# EasyEDA Pro project controler.epro, board PCB1_2
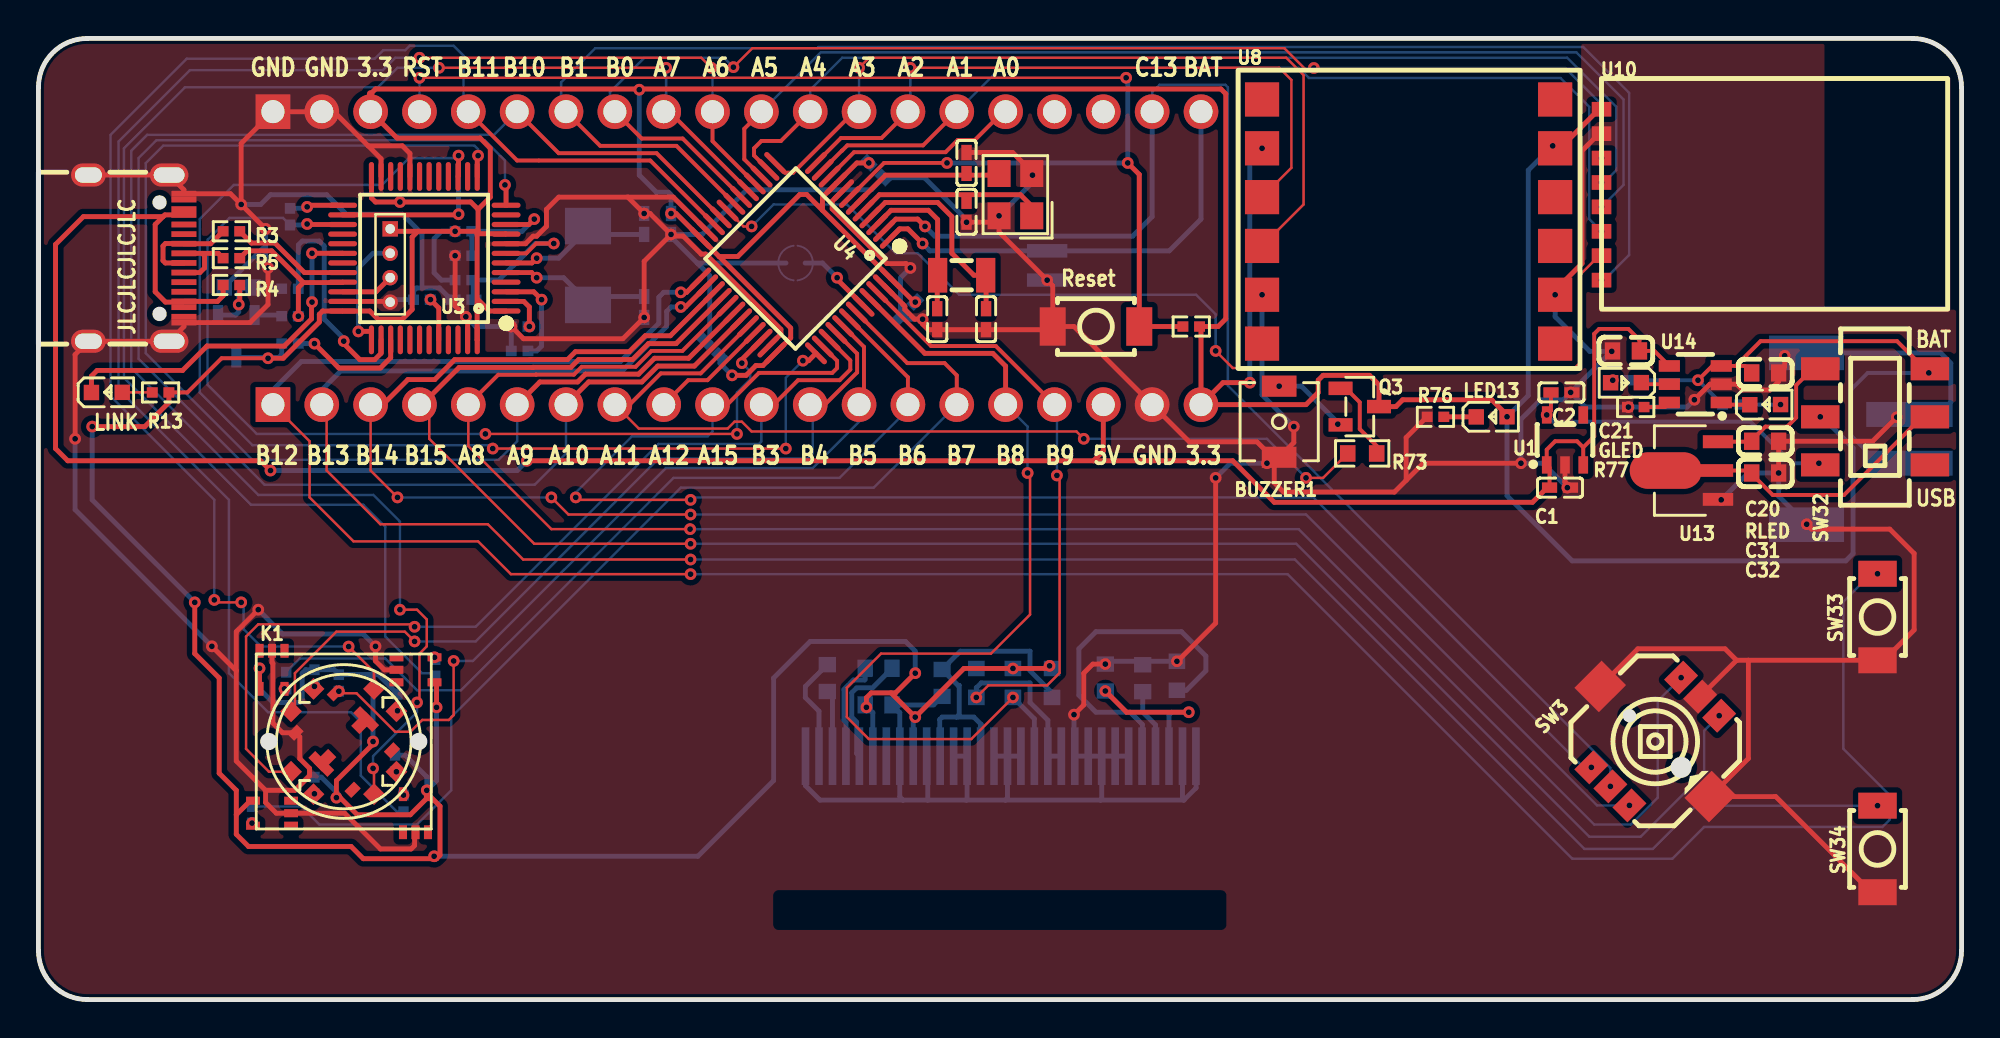
[diagram p1: board, top side]
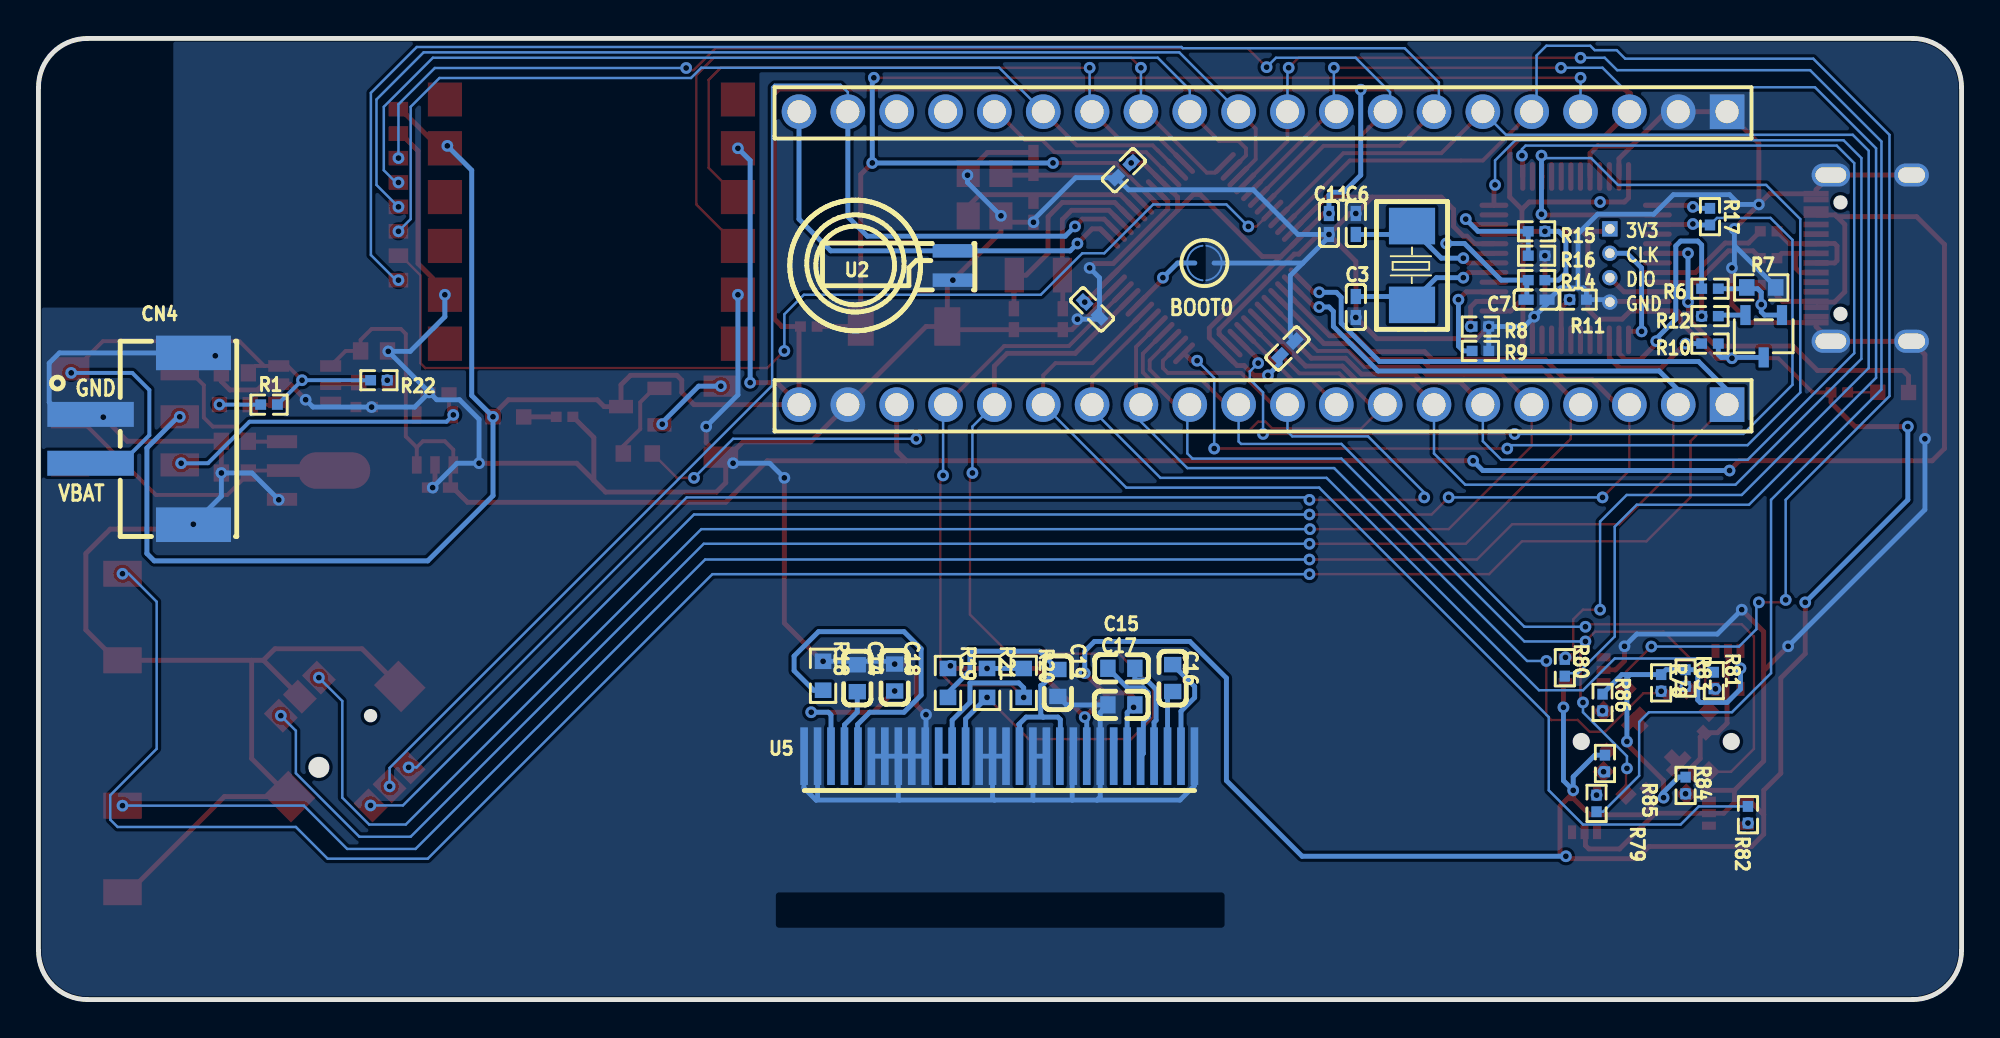
[diagram p2: board, bottom side, seen from below]

Outline 100 x 50 mm; copper layers: Top Layer, Bottom Layer. Coordinates in mm from the lower left corner of the outline.
Outline path: 0,47.46 0,2.54 arc(0.74,0.74) 2.54,0 97.46,0 arc(99.26,0.74) 100,2.54 100,47.46 arc(99.26,49.26) 97.46,50 2.54,50 arc(0.74,49.26) 0,47.46
Stack: Top Layer 0.035mm / Dielectric1 1.51mm FR4 er 4.5 / Bottom Layer 0.035mm

## Design rules (mm)
spacing safeClearance (default): track to track 0.152, other pairs 0.152 to 0.3
spacing Copper_copperRegion: track to track 0.152, other pairs 0.152 to 0.3
spacing Plane_innerPlane: track to track 0.152, other pairs 0.152 to 0.3
track width trackWidth (default): min 0.127, default 0.254, max 2.54
differential pair differentialPair (default): width min 0.127, default 0.254, max 2.54; gap min 0.152, default 0.152
net GND uses copperRegion

## Placement (name value [footprint] x y rotation side)
BUZZER1  4kHz  [BUZ-SMD_2P-L4.0-W4.0-L_GSC4317YA]  64.52 30.06 270 top
C1  1uF  [C0402_1]  79.12 26.63 180 top
C2  1uF  [C0402_1]  79.19 31.58 180 top
C3  20pF  [C0402]  31.5 36.03 270 bottom
C4  12pF  [C0402]  46.74 35.39 90 top
C5  12pF  [C0402]  49.28 35.39 270 top
C6  20pF  [C0402]  31.5 40.35 90 bottom
C7  100nF  [C0402]  22.1 36.41 0 bottom
C8  20pF  [C0402]  48.26 40.98 90 top
C9  20pF  [C0402]  48.26 43.52 270 top
C10  100nF  [C0402]  43.56 43.14 135 bottom
C11  100nF  [C0402]  32.89 40.35 90 bottom
C12  100nF  [C0402]  35.05 33.87 315 bottom
C13  100nF  [C0402]  45.21 35.9 45 bottom
C14  4.7uf  [C0603]  57.42 16.72 270 bottom
C15  1uf  [C0603]  43.69 17.23 0 bottom
C16  1uf  [C0603]  41.02 16.73 90 bottom
C17  10uf  [C0603]  43.69 15.33 180 bottom
C18  2.2uf  [C0603]  55.48 16.75 270 bottom
C19  100nF  [C0603]  46.99 16.47 270 bottom
C20  10uF  [C0603_1]  89.79 32.6 180 top
C21  10uF  [C0603_1]  82.55 33.74 0 top
C31  10u  [C0603_1]  89.79 29.05 180 top
C32  10u  [C0603_1]  89.79 27.39 180 top
CN4  2.54-2A-LT  [CONN-SMD_2P-P2.54_XH2.54-2AB]  94.62 29.17 270 bottom
GLED  ORH-G36G  [LED0603-RD_1]  82.55 32.09 180 top
J1  -  [HDR-TH_20P-P2.54-V-M-1]  36.32 46.19 0 bottom
J2  -  [HDR-TH_20P-P2.54-V-M-1]  36.32 30.95 0 bottom
K1  -  [EVQWJN005]  15.88 13.42 0 top
LED2  NCD0603Y1  [LED0603-RD]  3.56 31.58 0 top
LED13  -  [LED0603-RD_1]  75.56 30.31 0 top
P1  -  [1.27-4P烧录孔]  18.29 38.19 270 top
PAN1  -  [短接焊盘-2mm]  39.37 38.32 0 bottom
Q1  S8050 J3Y  [SOT-23-3_L3.0-W1.7-P0.95-LS2.9-BR]  10.29 34.51 90 bottom
Q3  S8550  [SOT-23-3_L2.9-W1.3-P1.90-LS2.4-BR]  68.71 30.85 180 top
R1  1K  [R0402_1]  88.01 30.95 180 bottom
R2  10kΩ  [R0402]  59.94 35.01 0 top
R3  10Ω  [R0402]  10.03 39.97 0 top
R4  10kΩ  [R0402]  10.03 37.17 180 top
R5  10Ω  [R0402]  10.03 38.57 0 top
R6  100Ω  [R0402]  13.08 36.98 0 bottom
R7  36kΩ  [R0603]  10.41 37.05 0 bottom
R8  10kΩ  [R0402]  25.02 35.01 180 bottom
R9  10kΩ  [R0402]  25.02 33.74 180 bottom
R10  4.7kΩ  [R0402]  13.08 34.12 180 bottom
R11  10kΩ  [R0402]  19.94 36.41 0 bottom
R12  1.5kΩ  [R0402]  13.08 35.55 180 bottom
R13  1kΩ  [R0402]  6.35 31.58 180 top
R14  100kΩ  [R0402]  22.1 37.43 180 bottom
R15  4.7kΩ  [R0402]  22.1 39.97 180 bottom
R16  4.7kΩ  [R0402]  22.1 38.7 0 bottom
R17  100Ω  [R0402]  13.08 40.73 270 bottom
R18  1M  [R0603]  59.2 16.84 270 bottom
R19  5.1k  [R0603]  52.71 16.47 270 bottom
R20  5.1k  [R0603]  48.77 16.47 270 bottom
R21  5.1k  [R0603]  50.67 16.47 270 bottom
R22  1K  [R0402_1]  82.3 32.22 0 bottom
R73  1kΩ  [R0603]  68.83 28.41 180 top
R76  1kΩ  [R0402_1]  72.64 30.31 0 top
R77  1.5K  [R0402_1]  83.06 30.82 0 top
R78  4.7K  [R0402]  15.62 16.47 90 bottom
R79  10kΩ  [R0402]  18.98 10.2 270 bottom
R80  10kΩ  [R0402]  20.63 17.26 270 bottom
R81  10kΩ  [R0402]  12.88 16.59 90 bottom
R82  10kΩ  [R0402]  11.11 9.61 90 bottom
R83  1kΩ  [R0402]  14.35 16.73 270 bottom
R84  1kΩ  [R0402]  14.35 11.14 270 bottom
R85  1kΩ  [R0402]  18.54 12.28 270 bottom
R86  1kΩ  [R0402]  18.67 15.46 270 bottom
RLED  ORH-G36G  [LED0603-RD_1]  89.79 30.95 0 top
SW1  -  [SW-SMD_L3.9-W2.9-P4.15-LS5.0]  54.99 35.01 0 top
SW3  K1-5202UA-01  [SW-SMD_K1-5202UA-01]  84.07 13.42 45 top
SW32  MST22D18G2  [SW-SMD_MST22D18G2]  95.5 30.31 90 top
SW33  -  [SW-SMD_L3.9-W2.9-P4.15-LS5.0]  95.63 19.9 90 top
SW34  -  [SW-SMD_L3.9-W2.9-P4.15-LS5.0]  95.63 7.84 90 top
U1  XC6210B332MR  [SOT-25_L3.0-W1.6-P0.95-LS2.8-BL_1]  79.38 29.11 0 top
U2  -  [CAP-SMD_FL11E]  52.45 38.19 180 bottom
U3  STM32F103CBT6  [LQFP-48_L7.0-W7.0-P0.50-LS9.0-BL]  20.07 38.57 90 top
U4  -  [LQFP-48_L7.0-W7.0-P0.50-LS9.0-BL]  39.37 38.57 135 top
U5  SSD1306  [1.3OLED-2]  50.42 13.42 0 bottom
U8  -  [JY901S]  63.63 46.83 0 top
U10  -  [nrf24f01贴片模块]  81.28 46.32 0 top
U13  ME6209A33PG  [SOT-89-3_L4.5-W2.5-P1.50-LS4.2-BR]  85.98 27.52 0 top
U14  TP4059  [SOT-23-6_L2.9-W1.6-P0.95-LS2.8-BR]  86.16 32.01 0 top
USB1  -  [USB-C_SMD-TYPE-C-31-M-12]  5.08 38.57 270 top
X1  32.768kHz  [FC-135R_L3.2-W1.5]  48.01 37.68 0 top
X2  8MHz  [CRYSTAL-SMD_L5.0-W3.2]  28.57 38.19 270 bottom
X3  8MHz  [CRYSTAL-SMD_4P-L3.2-W2.5-BL]  50.8 41.87 90 top

## Footprints (pads in the part's own frame, mm; a bottom-side part is the same pattern mirrored in y, then rotated)
1.3OLED-2
  rect 0.4x3 smd: 1(-10.531,0.762) 2(-9.831,0.763) 3(-9.131,0.762) 4(-8.431,0.762) 5(-7.731,0.762) 6(-7.031,0.762) 7(-6.331,0.762) 8(-5.631,0.762) 9(-4.931,0.762) 10(-4.231,0.762) 11(-3.531,0.762) 12(-2.831,0.762) 13(-2.131,0.762) 14(-1.431,0.762) 15(-0.731,0.762) 16(-0.031,0.762) 17(0.669,0.762) 18(1.369,0.762) 19(2.069,0.763) 20(2.769,0.762) 21(3.469,0.761) 22(4.169,0.762) 23(4.869,0.762) 24(5.569,0.762) 25(6.269,0.763) 26(6.969,0.762) 27(7.669,0.763) 28(8.369,0.762) 29(9.069,0.762) 30(9.769,0.762)
1.27-4P烧录孔
  rect 0.8x0.8 hole 0.5: 1(-1.905,0)
  round 0.8 hole 0.5: 2(-0.635,0) 3(0.635,0) 4(1.905,0)
BUZ-SMD_2P-L4.0-W4.0-L_GSC4317YA
  rect 1.1x1.8 smd: 1(-1.85,0) 2(1.85,0)
C0402
  rect 0.79x0.54 smd: 1(-0.545,0) 2(0.545,0)
C0402_1
  rect 0.79x0.54 smd: 1(-0.545,0) 2(0.545,0)
C0603
  rect 0.8x0.9 smd: 1(-0.7,0) 2(0.7,0)
C0603_1
  rect 0.8x0.9 smd: 1(-0.7,0) 2(0.7,0)
CAP-SMD_FL11E
  rect 2.1x0.7 smd: 1(0,0.762) 2(0,-0.762)
CONN-SMD_2P-P2.54_XH2.54-2AB
  rect 1.3x4.5 smd: 1(-1.27,-2.675) 2(1.27,-2.675)
  rect 1.8x3.9 smd: 3(-4.47,2.675) 4(4.47,2.675)
CRYSTAL-SMD_4P-L3.2-W2.5-BL
  rect 1.4x1.2 smd: 1(-1.1,-0.85) 2(1.1,-0.85) 3(1.1,0.85) 4(-1.1,0.85)
CRYSTAL-SMD_L5.0-W3.2
  rect 1.9x2.401 smd: 1(-2.05,0) 2(2.05,0)
EVQWJN005
  rect 0.42x0.72 smd: A1(3.73,-4.72) A2(4.38,-2.74) A3(3.08,-2.74) A4(4.38,-4.72) A5(3.08,-4.72) C1(-3.73,4.72) C2(-4.38,2.74) C3(-3.08,2.74) C4(-4.38,4.72) C5(-3.08,4.72)
  rect 0.72x0.42 smd: B1(2.74,3.73) B2(4.72,3.08) B3(4.72,4.38) B4(2.74,3.08) B5(2.74,4.38) D1(-2.74,-3.73) D2(-4.72,-3.08) D3(-4.72,-4.38) D4(-2.74,-3.08) D5(-2.74,-4.38)
  rect 0.5x0.7 smd rot 135: K1(-0.46,2.51) K2(-2.51,0.46) K3(0.46,-2.51) K4(2.51,-0.46)
  rect 0.8x0.8 smd rot 135: L1(-1.573,2.74) L2(-2.74,1.573) L5(2.74,-1.573) L6(1.573,-2.74)
  rect 0.8x0.8 smd rot 45: L3(-1.573,-2.74) L4(-2.74,-1.573) L7(2.74,1.573) L8(1.573,2.74)
  rect 0.6x1.05 smd rot 135: T1(0.972,0.972) T2(-0.972,-0.972)
  rect 1.4x0.5 smd rot 135: T1(1.167,1.167) T2(-1.167,-1.167)
FC-135R_L3.2-W1.5
  rect 1.001x1.801 smd: 1(-1.25,0) 2(1.25,0)
HDR-TH_20P-P2.54-V-M-1
  rect 1.801x1.801 hole 1.199: 1(-24.13,0)
  round 1.801 hole 1.199: 2(-21.59,0) 3(-19.05,0) 4(-16.51,0) 5(-13.97,0) 6(-11.43,0) 7(-8.89,0) 8(-6.35,0) 9(-3.81,0) 10(-1.27,0) 11(1.27,0) 12(3.81,0) 13(6.35,0) 14(8.89,0) 15(11.43,0) 16(13.97,0) 17(16.51,0) 18(19.05,0) 19(21.59,0) 20(24.13,0)
JY901S
  rect 1.778x1.778 smd: 1(0,0) 2(0,-2.54) 3(0,-5.08) 4(0,-7.62) 5(0,-10.16) 6(0,-12.7) 7(15.24,-12.7) 8(15.24,-10.16) 9(15.24,-7.62) 10(15.24,-5.08) 11(15.24,-2.54) 12(15.24,0)
LED0603-RD
  rect 0.8x0.8 smd: 1(-0.799,-0.004) 2(0.799,0.004)
LED0603-RD_1
  rect 0.8x0.8 smd: 1(-0.799,-0.004) 2(0.799,0.004)
LQFP-48_L7.0-W7.0-P0.50-LS9.0-BL
  oval 0.269x1.501 smd: 1(-2.751,-4.25) 2(-2.251,-4.25) 3(-1.75,-4.25) 4(-1.25,-4.25) 5(-0.75,-4.25) 6(-0.249,-4.25) 7(0.249,-4.25) 8(0.75,-4.25) 9(1.25,-4.25) 10(1.75,-4.25) 11(2.251,-4.25) 12(2.751,-4.25) 25(2.751,4.25) 26(2.251,4.25) 27(1.75,4.25) 28(1.25,4.25) 29(0.75,4.25) 30(0.249,4.25) 31(-0.249,4.25) 32(-0.75,4.25) 33(-1.25,4.25) 34(-1.75,4.25) 35(-2.251,4.25) 36(-2.751,4.25)
  oval 1.501x0.269 smd: 13(4.25,-2.751) 14(4.25,-2.251) 15(4.25,-1.75) 16(4.25,-1.25) 17(4.25,-0.75) 18(4.25,-0.249) 19(4.25,0.249) 20(4.25,0.75) 21(4.25,1.25) 22(4.25,1.75) 23(4.25,2.251) 24(4.25,2.751) 37(-4.25,2.751) 38(-4.25,2.251) 39(-4.25,1.75) 40(-4.25,1.25) 41(-4.25,0.75) 42(-4.25,0.249) 43(-4.25,-0.249) 44(-4.25,-0.75) 45(-4.25,-1.25) 46(-4.25,-1.75) 47(-4.25,-2.251) 48(-4.25,-2.751)
nrf24f01贴片模块
  rect 1.016x0.762 smd: 1(0,0) 2(0,-1.27) 3(0,-2.54) 4(0,-3.81) 5(0,-5.08) 6(0,-6.35) 7(0,-7.62) 8(0,-8.89)
R0402
  rect 0.566x0.54 smd: 1(-0.433,0) 2(0.433,0)
R0402_1
  rect 0.566x0.54 smd: 1(-0.433,0) 2(0.433,0)
R0603
  rect 0.806x0.864 smd: 1(-0.753,0) 2(0.753,0)
SOT-23-3_L2.9-W1.3-P1.90-LS2.4-BR
  rect 1.25x0.7 smd: 1(1,-0.95) 2(1,0.95) 3(-1,0)
SOT-23-3_L3.0-W1.7-P0.95-LS2.9-BR
  rect 1.038x0.532 smd: 1(1.101,-0.95) 2(1.101,0.95) 3(-1.101,0)
SOT-23-6_L2.9-W1.6-P0.95-LS2.8-BR
  rect 1.1x0.6 smd: 1(1.35,-0.95) 2(1.35,0) 3(1.35,0.95) 4(-1.35,0.95) 5(-1.35,0) 6(-1.35,-0.95)
SOT-25_L3.0-W1.6-P0.95-LS2.8-BL_1
  rect 0.5x0.899 smd: 1(-0.95,-1.3) 2(0,-1.3) 3(0.95,-1.3) 4(0.95,1.3) 5(-0.95,1.3)
SOT-89-3_L4.5-W2.5-P1.50-LS4.2-BR
  rect 1.575x0.672 smd: 1(1.356,-1.5) 3(1.356,1.5)
  custom 5.377x1.9 smd: 2(-1.356,0)
SW-SMD_K1-5202UA-01
  rect 1.4x1.1 smd: 1(-3.3,1.4) 2(-3.3,0) 3(-3.3,-1.4) 4(3.3,1.4) 5(3.3,0) 6(3.3,-1.4)
  rect 2x1.8 smd: 7(0,4.05) 8(0,-4.05)
SW-SMD_L3.9-W2.9-P4.15-LS5.0
  rect 1.351x1.999 smd: 1(-2.251,0) 2(2.251,0)
SW-SMD_MST22D18G2
  rect 1.2x2 smd: 1(-2.5,2.85) 2(0,2.85) 3(2.5,2.85) 4(-2.5,-2.85) 5(0,-2.85) 6(2.5,-2.85)
USB-C_SMD-TYPE-C-31-M-12
  oval 1.2x2 hole 0.8x1.6: 0(-4.325,1.716) 0(4.325,1.716)
  oval 1.2x1.8 hole 0.8x1.4: 0(-4.325,-2.484) 0(4.325,-2.484)
  rect 0.3x1.3 smd: A1(-3.35,2.484) A4(-2.55,2.484) A5(-1.25,2.484) A6(-0.25,2.484) A7(0.25,2.484) A8(1.25,2.484) A9(2.55,2.484) A12(3.35,2.484) B1(3.05,2.484) B4(2.25,2.484) B5(1.75,2.484) B6(0.75,2.484) B7(-0.75,2.484) B8(-1.75,2.484) B9(-2.25,2.484) B12(-3.05,2.484)
短接焊盘-2mm
  custom 0.8x1.8 smd: 1(-0.5,0) 2(0.5,0)

## Nets
As in the schematic, except:
GND: BUZZER1.2 C1.1 C2.1 C3.2 C4.1 C5.2 C6.2 C7.1 C8.1 C9.1 C10.1 C11.1 C12.1 C13.1 C14.1 C17.1 C18.1 C19.2 C20.1 C21.1 C31.1 C32.1 CN4.1 CN4.3 CN4.4 J1.1 J1.2 J2.19 K1.A1 K1.B1 K1.C1 K1.D1 K1.K2 P1.4 PAN1.1 R7.1 R8.2 R9.2 R11.1 R16.1 R18.1 R76.1 R77.1 SW1.1 SW3.5 SW3.7 SW3.8 SW33.1 SW34.1 U1.2 U2.2 U3.8 U3.20 U3.23 U3.35 U3.47 U4.8 U4.23 U4.35 U4.47 U5.1 U5.8 U5.10 U5.12 U5.13 U5.15 U5.16 U5.17 U5.21 U5.22 U5.23 U5.24 U5.25 U5.29 U5.30 U8.5 U8.8 U10.2 U13.1 U14.2 USB1.0 USB1.A1 USB1.A12 USB1.B1 USB1.B12 X3.2 X3.4

Pads without a net: J1 17 18; K1 A4 A5 B4 B5 C4 C5 D4 D5 K3 K4 T1 T2; SW32 4; U1 4; U3 4 11 14 16 17 18 19 21 22 28 29 31 40 41 42 43 45 46; U5 7; U8 1 6 7 9 10 12; USB1 A5 A8 B5 B8

## Via types
v1: diameter 0.61, hole 0.305, Top Layer to Bottom Layer, 166 vias

## Routing (per net, layer and track width the routed paths; a pad name or vN(x,y) marks a point on that pad's centre or on a via; arc(x,y) is an arc through that point)
3V3: length 380.6
  Top Layer w0.203: v1(11.94,33.36) 9.53,33.36 7.75,31.58 R13.1
  Top Layer w0.254: v1(76.36,30.32) 76.36,30.4 75.56,31.2 70.94,31.2 70.59,30.85 Q3.3 69.71,31.98 69.22,32.47 66.8,32.47 66.55,32.22 66.55,31.58 65.91,30.95 J2.20 ; K1.A2 20.88,10.06 20.88,7.51 20.7,7.33 ; K1.A2 20.25,10.53 19.33,9.61 16.58,9.61 15.69,10.5 v1(15.49,10.5) 15.49,11.39 17.4,13.3 v1(17.4,13.42) ; K1.A2 20.19,10.75 v1(20.19,10.88) ; U3.24 17.31,41.7 17.53,41.49 v1(18.8,41.49) 22.48,41.49 22.86,41.11 ; K1.D2 11.02,10.34 10.29,9.61 ; 20.7,7.33 16.89,7.33 16.26,7.96 10.92,7.96 10.29,8.6 10.29,9.61 ; 20.7,7.33 v1(20.57,7.45) ; U3.48 22.81,34.33 22.81,39.84 24.3,39.84 U3.9 ; v1(45.59,16.98) 44.57,15.95 44.33,15.95 ; 19.73,39.97 18.42,39.97 P1.1 ; 19.73,39.97 19.43,39.67 19.43,35.9 18.92,35.39 17.65,35.39 17.23,35.82 14.78,35.82 14.61,35.65 14.61,35.24 12.73,33.36 v1(11.94,33.36) ; 19.73,39.97 v1(21.67,39.97) 22.86,39.97 22.86,41.11 ; 44.33,15.95 43.31,15.95 43.05,15.7 v1(43.05,15.2) ; 44.33,15.95 v1(45.59,14.69) 48.12,17.22 v1(50.67,17.22) 52.58,17.22 v1(52.58,17.36) ; 10.29,9.61 10.29,10.88 9.4,11.77 9.4,16.73 8.13,18 v1(8.13,20.66) ; 35.39,38.66 39.12,34.93 39.12,34.43 U4.36 37.67,32.98 37.31,32.98 36.8,32.47 v1(36.07,32.47) ; 35.39,38.66 36.37,38.66 39.59,41.88 39.95,41.88 40.77,41.06 ; 35.39,38.66 U4.24 33.16,40.89 v1(32.89,40.89) ; K1.C2 v1(11.5,17.23) ; v1(62.99,32.09) 61.59,32.09 J2.20 ; J2.20 60.45,34.94 R2.2 61.34,35.01 61.74,35.41 61.74,47.12 61.49,47.37 17.53,47.37 17.27,47.12 ; 22.86,41.11 23.5,41.75 23.5,44.28 22.96,44.82 18.64,44.82 J1.3 ; U10.1 81.15,46.32 79.25,44.41 v1(78.74,44.41) U8.11 ; 40.77,41.06 40.77,41.75 41.48,42.46 U4.9 42.56,43.52 v1(43.18,43.52) ; 40.77,41.06 U4.48 45.55,36.28 v1(45.59,36.28) ; v1(20.7,15.2) 20.7,16.4 K1.B2 ; 22.86,36.41 23.45,35.82 24.32,35.82 ; v1(2.79,29.81) 5.53,29.81 6.78,31.06 R13.1
  Top Layer w0.381: J1.3 17.27,47.12
  Bottom Layer w0.254: U5.9 45.49,14.59 v1(45.59,14.69) ; v1(31.24,47.33) 31.24,42.89 32.13,42 32.77,42 32.89,41.87 v1(32.89,40.89) ; v1(21.67,39.97) 20.95,39.97 20.57,39.59 20.57,37.81 20.95,37.43 R14.2 ; v1(92.65,30.31) 92.74,30.31 94.36,28.69 94.36,23.2 93.98,22.82 79.76,22.82 76.36,26.21 v1(76.36,30.32) 77.47,31.42 77.47,43.14 v1(78.74,44.41) ; v1(43.05,15.2) 42.99,15.27 C17.2 43.39,14.93 U5.6 ; v1(20.57,7.45) 34.29,7.45 38.23,11.39 38.23,16.73 40.13,18.63 45.09,18.63 45.59,18.12 v1(45.59,16.98) ; v1(8.13,20.66) 2.79,26 v1(2.79,29.81) ; 17.23,16.91 17.4,16.74 v1(17.4,13.42) ; 17.23,16.91 R78.2 15.37,17.16 R83.1 ; 17.23,16.91 17.67,16.91 18.67,15.9 18.67,15.89 ; 48.77,17.22 v1(50.67,17.22) ; v1(15.49,10.5) 15.57,10.58 15.57,10.71 14.71,11.57 R84.1 ; v1(36.07,32.47) 35.44,33.1 C12.2 ; v1(20.7,15.2) 20.7,11.39 v1(20.19,10.88) 20.19,11.59 19.07,12.71 R85.1 ; v1(52.58,17.36) 52.71,17.23 52.71,17.22 ; 14.35,17.16 13.9,17.16 13.72,16.98 13.72,15.58 13.59,15.46 12.19,15.46 11.5,16.15 v1(11.5,17.23) ; v1(62.99,32.09) 62.99,43.65 v1(63.63,44.28) ; R10.2 12.65,33.56 12.49,33.4 Q1.3
GND: length 471.4
  Top Layer w0.254: 88.3,17.65 88.92,17.65 ; 88.3,17.65 SW3.5 ; 88.3,17.65 87.7,18.25 83.17,18.25 SW3.7 ; 88.92,17.65 SW33.1 95.96,17.65 97.54,19.23 97.54,23.2 96.27,24.47 92.2,24.47 v1(91.95,24.73) ; 88.92,17.65 88.92,12.54 SW3.8 90.33,10.56 95.31,5.59 SW34.1 ; SW1.1 53.85,35.01 J2.19 59.85,29.02 63.36,29.02 64.17,28.21 BUZZER1.2 ; SW1.1 52.58,34.85 C5.2 C4.1 46.26,34.85 45.97,35.14 v1(45.97,35.39) 45.56,35.39 45.05,35.9 45.05,36.06 44.96,36.16 44.96,36.16 U4.47 ; SW1.1 52.74,37.14 v1(52.45,37.43) 49.95,39.93 v1(49.95,40.77) 49.62,40.44 v1(48.26,40.44) ; 30.64,41.75 33.01,41.75 U4.23 ; 30.64,41.75 v1(31.5,40.89) 31.8,40.89 v1(32.89,39.8) ; 30.64,41.75 27.05,41.75 26.42,41.11 26.42,40.22 25.91,39.71 25.72,39.71 25.33,39.32 U3.8 ; U4.35 38.61,34.63 38.61,34.87 34.69,38.78 34.46,38.78 33.53,39.71 32.98,39.71 v1(32.89,39.8) ; v1(32.89,39.8) 31.5,38.41 v1(31.5,35.48) 30.39,34.38 25.22,34.38 v1(24.59,35.01) ; U3.23 17.82,43.74 17.14,44.41 ; 11.81,10.88 11.81,10.25 12.37,9.69 K1.D1 15.92,9.69 17.78,7.84 19.38,7.84 19.56,8.02 19.56,8.66 K1.A1 ; 11.81,10.88 13.33,10.88 14.1,11.65 14.1,12.03 13.59,12.53 13.59,13.66 K1.K2 12.69,13.88 12.19,14.38 12.19,17.48 12.14,17.53 K1.C1 ; 11.81,10.88 10.29,12.41 10.29,17.11 ; v1(17.53,18.38) 17.53,17.61 17.99,17.15 K1.B1 ; 17.14,44.41 18.92,44.41 19.32,44.02 U3.20 ; 17.14,44.41 15.37,46.19 J1.2 J1.1 10.54,44.54 v1(10.54,41.36) ; C9.1 50.65,44.07 51.65,43.07 X3.2 51.69,42.93 v1(51.69,42.89) ; v1(81.81,33.72) 81.83,33.72 C21.1 ; v1(59.2,17.6) 59.23,17.6 61.21,19.58 v1(61.21,27.14) ; v1(77.09,27.9) 72.01,27.9 71.12,27.01 ; 64.26,27.96 BUZZER1.2 ; 64.26,27.96 64.26,26.89 64.74,26.4 70.51,26.4 71.12,27.01 ; 64.26,27.96 64.21,27.9 v1(63.88,27.9) ; BUZZER1.2 65.28,28.97 v1(65.28,29.81) ; v1(87.5,26) 87.36,26 U13.1 ; v1(45.34,38.06) 45.11,38.29 44.12,38.29 41.28,41.13 41.28,41.53 U4.8 ; v1(90.81,33.49) 90.81,32.92 C20.1 90.49,32.16 90.04,31.71 88.61,31.71 88.31,32.01 U14.2 86.91,32.01 v1(86.11,31.2) ; v1(96.63,30.3) 95.38,29.05 C31.1 v1(90.49,27.39) ; v1(9.02,18.38) 10.29,17.11 ; 10.29,17.11 10.29,19.14 v1(11.43,20.28) ; v1(53.85,14.82) 54.36,15.33 54.36,16.98 54.83,17.45 v1(55.48,17.45) ; 71.12,27.01 71.12,29.24 72.2,30.31 R76.1 ; v1(1.91,29.17) 1.91,33.55 USB1.0 USB1.0 7.56,35.01 USB1.A12 11,35.22 11.94,36.16 v1(11.94,38.06) ; USB1.0 USB1.0 7.56,42.13 USB1.A1 9.98,41.92 v1(10.54,41.36) ; v1(79.5,26.63) C1.1 79.38,26.92 U1.2 ; U3.47 22.32,35.43 v1(22.22,35.52) 21.67,36.08 v1(21.67,38.7) ; U3.35 18.25,36.32 P1.4 ; v1(10.54,41.36) v1(11.81,40.09) ; 79.68,31.58 C2.1 ; v1(78.87,36.67) 78.75,36.78 80.26,38.29 80.26,44.16 81.15,45.05 U10.2
  Bottom Layer w0.254: U5.12 U5.13 48.29,10.42 48.25,10.38 ; U5.16 50.39,10.48 50.28,10.38 ; U5.16 U5.17 ; U5.16 U5.15 ; 44.96,10.38 44.79,10.55 U5.8 44.79,14.93 C17.1 46.55,15.33 C19.2 ; 44.96,10.38 40.64,10.38 39.89,11.13 U5.1 ; 44.96,10.38 46.24,10.38 ; 50.28,10.38 55.23,10.38 ; 50.28,10.38 48.25,10.38 ; v1(79.67,31.59) 79.29,31.2 78.1,31.2 77.09,30.19 v1(77.09,27.9) 78.23,27.9 v1(79.5,26.63) ; v1(79.67,31.59) v1(81.81,33.72) 80.67,33.72 78.87,35.52 v1(78.87,36.67) ; v1(79.67,31.59) 80.44,30.82 v1(82.68,30.82) 85.72,30.82 v1(86.11,31.2) ; 19.94,37.02 19.94,39.84 18.92,40.86 16,40.86 14.99,41.87 12.06,41.87 11.56,41.36 v1(10.54,41.36) ; 19.94,37.02 20.85,37.02 21.46,36.41 C7.1 21.55,36.19 v1(22.22,35.52) 22.73,35.01 v1(24.59,35.01) R9.2 ; 19.94,37.02 19.66,37.02 19.51,36.87 R11.1 18.42,36.41 P1.4 ; 11.81,39.22 11.81,38.19 v1(11.94,38.06) ; 11.81,39.22 9.66,37.08 R7.1 ; 11.81,39.22 v1(11.81,40.09) ; v1(59.2,17.6) 55.62,17.6 v1(55.48,17.45) ; 55.23,10.38 59.56,10.38 ; 55.23,10.38 55.29,10.43 U5.23 ; 59.56,10.38 59.49,10.45 U5.29 ; 59.56,10.38 60.2,11.01 60.2,12.65 U5.30 ; U5.10 46.24,12.61 46.24,10.38 ; v1(53.85,14.82) 53.85,12.7 U5.21 U5.22 U5.23 ; U5.23 U5.24 ; v1(51.69,42.89) 51.69,42.51 v1(49.95,40.77) ; v1(63.63,36.67) 63.63,31.46 v1(65.28,29.81) ; v1(96.63,30.3) 96.77,30.44 CN4.1 98.81,30.44 99.44,31.08 99.44,33.11 98.91,33.64 CN4.3 90.96,33.64 v1(90.81,33.49) ; v1(87.5,26) 88.9,27.39 v1(90.49,27.39) 90.49,26.19 v1(91.95,24.73) 91.94,24.72 CN4.4 ; U5.25 55.99,12.66 ; v1(17.53,18.38) 16.89,19.01 12.7,19.01 v1(11.43,20.28) ; 46.24,10.38 48.25,10.38 ; v1(9.02,18.38) 1.91,25.49 v1(1.91,29.17) ; v1(61.21,27.14) 61.98,27.9 v1(63.88,27.9) ; 34.25,38.32 32.89,39.68 v1(32.89,39.8) 34.51,39.8 36.83,42.13 43.32,42.13 C10.1 46.07,42.76 48.26,40.56 v1(48.26,40.44) ; 34.25,38.32 34.9,37.67 34.9,34.49 C12.1 ; 34.25,38.32 PAN1.1 ; v1(45.34,38.06) 44.83,37.55 C13.1 44.95,35.39 v1(45.97,35.39)
VBAT: length 30.6
  Top Layer w0.203: 88.26,32.96 88.73,32.96 C20.2 ; 88.26,32.96 89.55,34.25 96.65,34.25 v1(98.3,32.6) 98.35,32.66 SW32.6 ; 88.26,32.96 U14.3 87.04,32.96 v1(86.3,32.22)
  Bottom Layer w0.203: R22.2 v1(86.3,32.22) 87.57,30.95 R1.2 ; v1(98.3,32.6) 95.12,32.6 94.23,31.71 94.23,29.36 95.69,27.9 CN4.2
BACK1: length 99.5
  Top Layer w0.127: v1(33.91,23.71) 25.78,23.71 20.32,29.17 20.32,30.44 J2.4
  Top Layer w0.254: U4.28 33.16,34.12 31.72,34.12 30.89,33.3 28.09,33.3 27.69,32.89 25.72,32.89 25.71,32.88 21.87,32.88 19.94,30.95 J2.4
  Bottom Layer w0.127: v1(33.91,23.71) 65.41,23.71 80.65,8.47 83.31,8.47 86.61,11.77 86.61,13.98 v1(87.4,14.77)
BAT_3.3V: length 7.9
  Top Layer w0.203: SW32.3 92.25,32.81 91.4,31.96 91.4,30.28 90.93,29.81 89.8,29.81 89.09,29.09 C31.2 89.06,29.02 U13.3
BAT_3.7V: length 16
  Top Layer w0.203: SW32.5 97.95,30.31 93.89,26.25 90.18,26.25 89.09,27.34 C32.2 88.96,27.52 U13.2
BOOT0: length 4
  Top Layer w0.254: U4.44 41.53,37.47 v1(41.53,37.55)
  Bottom Layer w0.254: v1(41.53,37.55) 40.77,38.32 PAN1.2
BUZZER: length 49.1
  Top Layer w0.127: J2.8 31.22,29.71 35.84,29.71 36.19,30.06 36.58,30.06 37.08,29.55 53.97,29.55 v1(54.36,29.17) ; v1(65.91,27.14) 66.8,27.14 68.07,28.41 R73.2
  Top Layer w0.203: U4.32 34.44,32.58 32.36,32.58 30.73,30.95 J2.8
  Bottom Layer w0.127: v1(65.91,27.14) 63.88,29.17 v1(54.36,29.17)
D+: length 4.1
  Top Layer w0.254: USB1.A6 8.51,38.82 ; 8.51,38.82 9.35,38.82 R5.1 ; 8.51,38.82 8.64,38.7 8.64,38.06 8.39,37.82 USB1.B6
D-: length 5.3
  Top Layer w0.254: R3.1 8.95,39.32 USB1.B7 7.55,39.33 6.6,39.33 6.48,39.2 6.48,38.44 6.6,38.32 USB1.A7
FRONT1: length 95.1
  Top Layer w0.127: v1(33.88,24.47) 26.67,24.47 22.35,28.79 J2.5
  Top Layer w0.203: U4.29 33.48,33.74 31.88,33.74 31.05,32.92 28.25,32.92 27.84,32.51 25.88,32.51 25.87,32.5 23.91,32.5 J2.5
  Bottom Layer w0.127: v1(33.88,24.47) 65.53,24.47 80.9,9.11 82.8,9.11 84.2,10.5 84.2,15.53 v1(85.42,16.75)
LED_STLINK: length 18.5
  Top Layer w0.254: LED2.1 2.76,32.44 3.05,32.73 7.49,32.73 8.76,34 12.79,34 14.2,35.41 14.2,36.26 v1(14.22,36.28) ; v1(14.22,38.82) 15.81,38.82 15.82,38.82
  Bottom Layer w0.254: v1(14.22,38.82) v1(14.22,36.28)
LEFT1: length 70.2
  Top Layer w0.254: U4.2 44.58,40.6 45.72,40.6 v1(46.1,40.22)
  Bottom Layer w0.127: J1.19 57.91,47.21 58.29,47.59 61.72,47.59 61.85,47.46 61.85,31.94 81.74,12.05 v1(81.74,11.09)
  Bottom Layer w0.254: J1.19 57.91,40.73 56.9,39.71 46.61,39.71 v1(46.1,40.22)
MPU6050B_RX: length 41.7
  Top Layer w0.127: U8.4 65.79,41.36 65.79,48.09 64.88,49 43.19,49 v1(42.67,48.47)
  Top Layer w0.203: J1.13 42.42,46.19 39.24,43.02 38.81,43.02 U4.13
  Bottom Layer w0.127: v1(42.67,48.47) J1.13
MPU6050B_TX: length 35
  Top Layer w0.127: v1(45.34,48.47) 64.52,48.47 65.15,47.84 65.15,43.27 U8.3
  Top Layer w0.203: J1.14 43.84,44.82 41.73,44.82 U4.12
  Bottom Layer w0.127: v1(45.34,48.47) 45.34,46.32 J1.14
NRF_CE: length 66.5
  Top Layer w0.127: v1(66.32,48.46) 66.21,48.35 65.93,48.35 64.78,49.49 37.12,49.49 v1(36.14,48.51)
  Top Layer w0.203: J1.8 31.37,44.79 33.5,44.79 36.54,41.75
  Bottom Layer w0.127: J1.8 29.72,46.44 29.72,47.21 31.51,49 35.65,49 v1(36.14,48.51) ; v1(66.32,48.46) 79.39,48.46 81.28,46.57 v1(81.28,43.78)
NRF_CSN: length 54.3
  Top Layer w0.203: J1.12 38.61,44.67 37.59,44.67 37.21,44.28 37.21,43.91 U4.14
  Bottom Layer w0.127: v1(81.28,42.51) 81.41,42.51 82.04,43.14 82.04,46.44 79.49,49 41.79,49 40.13,47.33 J1.12
NRF_IRQ: length 80.1
  Top Layer w0.203: 36.19,41.4 33.18,44.41 29.21,44.41 J1.7
  Bottom Layer w0.127: v1(81.28,37.43) 81.41,37.43 82.71,38.73 82.71,47.17 80.33,49.56 40.56,49.56 40.5,49.49 28.96,49.49 27.18,47.71 27.18,46.44 J1.7
NRF_MISO: length 56
  Top Layer w0.127: U4.20 36.66,40.22 v1(37.08,40.22) ; U10.7 81.15,38.7 80.14,37.68 80.14,33.11 79.88,32.86 62.1,32.86 v1(61.21,33.74)
  Bottom Layer w0.127: v1(61.21,33.74) 61.21,35.65 60.2,36.67 47.88,36.67 45.72,38.82 44.58,38.82 42.04,41.36 38.23,41.36 v1(37.08,40.22)
NRF_MOSI: length 49.6
  Top Layer w0.203: U4.11 41.78,44.17 41.79,44.17 42.06,44.44 46,44.44 J1.15
  Bottom Layer w0.127: v1(81.28,39.97) 80.65,40.6 80.65,46.44 79.15,47.94 66.07,47.94 65.53,48.47 50.04,48.47 J1.15
NRF_SCK: length 57.3
  Top Layer w0.203: U4.15 36.7,43.71 36.7,45.3 J1.11
  Bottom Layer w0.127: J1.11 40.68,49.28 79.97,49.28 82.42,46.83 82.42,42.38 v1(81.28,41.24)
NRST: length 69.2
  Top Layer w0.127: v1(56.56,47.95) v1(19.81,47.95)
  Top Layer w0.203: v1(47.24,43.52) 43.97,43.52 42.2,41.75
  Top Layer w0.254: R2.1 SW1.2 57.24,42.92 v1(56.64,43.52)
  Bottom Layer w0.127: v1(19.81,47.95) J1.4
  Bottom Layer w0.254: v1(47.24,43.52) v1(56.64,43.52) 56.64,47.87 v1(56.56,47.95)
PA0: length 10.6
  Top Layer w0.203: U4.10 42.41,44.08 47.17,44.08 47.8,44.72 48.69,44.72 50.16,46.19 J1.16
PA6: length 83.5
  Top Layer w0.127: v1(19.81,49) 34.47,49 v1(34.99,48.47)
  Top Layer w0.203: U4.16 35.05,44.66 J1.10
  Bottom Layer w0.127: J1.10 35.05,48.41 v1(34.99,48.47) ; 18.98,9.77 18.64,9.77 16.76,11.65 16.76,14.44 16.26,14.95 11.94,14.95 9.91,16.98 9.91,26 4.17,31.74 4.17,44.64 7.87,48.35 17.91,48.35 18.55,49 v1(19.81,49)
PA7: length 76.2
  Top Layer w0.127: v1(20.83,48.47) v1(32.64,48.47)
  Top Layer w0.203: U4.17 32.81,46.19 J1.9
  Bottom Layer w0.127: R80.2 20.48,16.98 19.94,16.98 18.03,18.89 18.03,24.6 16.89,25.74 11.05,25.74 4.44,32.35 4.44,44.28 7.62,47.46 17.65,47.46 18.67,48.47 v1(20.83,48.47) ; J1.9 32.64,46.32 v1(32.64,48.47)
PA9/TX: length 66.3
  Top Layer w0.254: 36.19,35.74 33.81,33.36 32.03,33.36 31.21,32.54 28.44,32.54 28.04,32.13 26.07,32.13 J2.6 ; v1(22.86,43.9) 22.82,43.86 U3.13
  Bottom Layer w0.127: J2.6 24.89,29.05 23.93,28.08 11.13,28.08 5.58,33.62 5.58,43.52 6.49,44.42 22.67,44.42 22.86,44.23 v1(22.86,43.9)
PA10/RX: length 71.8
  Top Layer w0.254: U3.12 24.32,42.32 v1(24.26,42.38) ; J2.7 28.61,32.13 31.38,32.13 32.2,32.96 34.11,32.96 36.54,35.39
  Bottom Layer w0.127: v1(24.26,42.38) 24.26,43.65 23.2,44.7 6.13,44.7 5.21,43.78 5.21,33.33 11.75,26.78 25.81,26.78 27.43,28.41 J2.7
PA12: length 6.3
  Top Layer w0.203: U4.33 34.79,32.22 33.78,32.22 J2.9
PA13/SWD: length 49.6
  Top Layer w0.127: v1(36.32,29.43) v1(23.24,29.43)
  Top Layer w0.254: v1(13.97,40.35) 14,40.32 U3.27 ; U4.34 36.58,33.3 v1(36.58,33.11)
  Bottom Layer w0.127: v1(23.24,29.43) 11.35,29.43 8.79,31.98 8.79,39.52 9.93,40.66 12.71,40.66 R17.2 ; v1(36.32,29.43) 36.32,31.58 37.01,32.27 37.01,32.68 v1(36.58,33.11)
  Bottom Layer w0.254: v1(13.97,40.35) 13.92,40.3 R17.2
PA14/SWC: length 71.5
  Top Layer w0.127: v1(23.62,28.66) v1(38.86,28.66)
  Top Layer w0.254: U4.37 40.05,33.24 v1(39.75,33.24) ; U3.26 21.81,40.82 v1(21.84,40.86) ; U3.15 21.84,42.85 v1(21.84,43.9)
  Bottom Layer w0.127: v1(21.84,43.9) 21.71,43.77 19.26,43.77 17.87,42.38 10.16,42.38 8.39,40.61 8.39,31.58 11.13,28.84 23.55,28.84 23.67,28.72 ; v1(39.75,33.24) 38.86,32.35 v1(38.86,28.66)
  Bottom Layer w0.254: v1(21.84,43.9) v1(21.84,40.86)
PA15: length 77.5
  Top Layer w0.127: v1(27.94,26.12) 28.07,26 v1(33.91,26)
  Top Layer w0.203: U4.38 41.53,33.23 41.53,32.86 41.28,32.6 37.47,32.6 35.81,30.95 J2.10
  Bottom Layer w0.127: v1(27.94,26.12) 27.94,26.38 30.86,29.3 34.8,29.3 35.05,29.55 J2.10 ; v1(80.75,12.08) 80.34,12.08 66.29,26.12 34.04,26.12 v1(33.91,26)
PB3: length 49.1
  Top Layer w0.127: v1(19.56,19.39) 19.43,19.52 11.43,19.52 10.8,18.89 10.8,13.04 11.99,11.85 K1.L4
  Top Layer w0.203: U4.39 42.22,33.25 42.22,32.77 41.66,32.22 39.5,32.22 38.23,30.95 J2.11
  Bottom Layer w0.127: J2.11 37.59,29.03 37.47,28.91 32.25,28.91 22.73,19.39 v1(19.56,19.39)
PB4: length 42.4
  Top Layer w0.127: v1(19.56,18.63) 19.05,19.14 15.49,19.14 13.33,16.98 13.33,15.2 K1.L2
  Top Layer w0.203: U4.40 42.57,33.6 42.57,32.63 40.89,30.95 J2.12
  Bottom Layer w0.127: v1(19.56,18.63) 22.73,18.63 32.25,28.14 39.99,28.14 40.26,28.41 40.26,30.82 J2.12
PB5: length 41.9
  Top Layer w0.127: v1(21.59,17.61) 21.59,14.8 21.34,14.54 19.95,14.54 19.34,13.93 18.54,13.93 16.54,15.93 K1.K1
  Top Layer w0.203: J2.13 42.93,31.2 42.93,33.95 U4.41
  Bottom Layer w0.127: J2.13 42.67,30.06 40.26,27.65 32.62,27.65 22.59,17.61 v1(21.59,17.61)
  vias: v1(15.62,16.04)
PB6: length 45.3
  Top Layer w0.203: 42.2,35.39 45.21,32.38 J2.14
  Bottom Layer w0.127: R81.2 12.88,17.04 13.59,17.74 18.03,17.74 19.69,16.09 21.97,16.09 33.02,27.14 41.66,27.14 45.21,30.7 J2.14
PB7: length 56.4
  Top Layer w0.203: 42.55,35.74 45.18,33.11 47.12,33.11 47.75,32.47 J2.15
  Bottom Layer w0.127: J2.15 43.43,26.63 33.4,26.63 21.46,14.69 21.46,10.88 19.69,9.11 14.61,9.11 13.66,10.05 R82.2
PB8: length 48.1
  Top Layer w0.127: v1(51.44,27.39) 51.56,27.27 51.56,20.03 49.53,18 43.81,18 42.04,16.22 42.04,14.69 43.18,13.55 48.51,13.55 v1(50.67,15.72)
  Top Layer w0.254: U4.45 46.09,33.62 49.63,33.62 50.29,32.95 J2.16
  Bottom Layer w0.127: v1(51.44,27.39) 51.44,29.81 J2.16
  Bottom Layer w0.254: v1(50.67,15.72) 51.79,14.6 U5.18
PB9: length 38.9
  Top Layer w0.127: v1(48.77,15.72) 49.39,16.34 52.45,16.34 53.1,16.99 53.1,27.13 v1(52.96,27.27)
  Top Layer w0.203: U4.46 46.42,34 49.78,34 J2.17
  Bottom Layer w0.127: v1(52.96,27.27) 52.96,30.82 J2.17
  Bottom Layer w0.254: v1(48.77,15.72) 48.77,16.22 49.02,16.47 51.56,16.47 51.56,15.46 52.49,14.53 U5.19 ; U5.20 52.49,12.66
PB10: length 78.8
  Top Layer w0.127: v1(17.4,12.03) 17.45,11.98 K1.L6 ; v1(19.69,15.46) 19.81,15.58 19.81,18 20.19,18.38 20.19,19.77 19.69,20.28 v1(18.8,20.28)
  Top Layer w0.203: U4.21 32.14,44.03 27.05,44.03 J1.6
  Bottom Layer w0.127: v1(19.69,15.46) 19.69,14.95 17.4,12.66 v1(17.4,12.03) ; v1(18.8,20.28) 18.8,24.87 17.41,26.25 11.43,26.25 4.83,32.86 4.83,44.16 5.65,44.98 23.69,44.98 J1.6
PB11: length 76.6
  Top Layer w0.127: K1.L8 17.45,17.05 v1(16.13,18.36) ; v1(9.14,20.79) 9.27,20.66 v1(10.54,20.66)
  Top Layer w0.203: 26.03,43.65 31.81,43.65 U4.22 ; 26.01,43.65 24.89,43.65 J1.5
  Bottom Layer w0.127: v1(9.14,20.79) 9.14,26 3.75,31.39 3.75,44.98 7.71,48.95 17.49,48.95 17.93,49.39 19.08,49.39 19.3,49.62 21.59,49.62 22.1,49.11 22.1,46.44 J1.5 ; v1(10.54,20.66) 10.67,20.54 10.67,19.27 11.57,18.36 v1(16.13,18.36)
PB12: length 137.3
  Top Layer w0.127: J2.1 14.1,29.05 14.1,26.12 16.38,23.84 22.86,23.84 24.57,22.13 v1(33.91,22.13)
  Top Layer w0.254: v1(33.4,36.79) 33.7,36.79 U4.25
  Bottom Layer w0.127: v1(33.91,22.13) 64.95,22.13 79.76,7.33 84.96,7.33 86.61,8.98 95.88,8.98 96.27,9.36 96.27,10.63 93.85,13.04 93.85,20.7 95.31,22.15 v1(95.63,22.15)
  Bottom Layer w0.254: J2.1 12.19,31.71 13.67,33.19 30.27,33.19 32.26,35.19 32.26,36.54 32.51,36.79 v1(33.4,36.79)
PB13: length 116.8
  Top Layer w0.127: v1(33.91,22.89) 25.2,22.89 23.37,24.73 17.78,24.73 14.99,27.52 14.99,30.7 J2.2
  Top Layer w0.254: v1(33.4,36.03) 33.65,36.03 U4.26
  Bottom Layer w0.127: v1(95.63,10.09) 86.2,10.09 83.95,7.84 80.39,7.84 65.33,22.89 v1(33.91,22.89)
  Bottom Layer w0.254: J2.2 14.73,31.71 15.72,32.7 30.35,32.7 32.66,35.02 32.66,35.8 32.89,36.03 v1(33.4,36.03)
PB14: length 96.4
  Top Layer w0.127: v1(18.67,26.12) 17.27,27.52 J2.3 ; v1(26.67,26.12) 27.56,25.23 v1(33.91,25.23)
  Top Layer w0.254: U4.27 32.86,34.53 31.55,34.53 30.72,33.7 27.92,33.7 27.52,33.3 25.55,33.3 25.54,33.29 21.64,33.29 20.61,32.25 19.21,32.25 17.91,30.95 J2.3
  Bottom Layer w0.127: v1(33.91,25.23) 65.91,25.23 81.05,10.1 v1(82.73,10.1) ; v1(26.67,26.12) v1(18.67,26.12)
PC14: length 8.3
  Top Layer w0.254: U4.3 44.33,41.06 46.28,41.06 46.76,40.58 X1.1 46.74,37.66 C4.2
PC15: length 10.8
  Top Layer w0.254: U4.4 44.03,41.47 46.76,41.47 47.5,40.73 47.5,38.82 48.64,37.68 X1.2 49.28,37.66 C5.1
PD0: length 9.8
  Top Layer w0.254: X3.1 51.65,41.28 51.05,41.87 43.73,41.87 U4.5
PD1: length 8.1
  Top Layer w0.254: X3.3 49.87,42.89 44.04,42.89 42.55,41.4
RTC_VBAT: length 23.1
  Top Layer w0.254: U4.1 44.78,40.09 45.21,40.09 v1(45.97,39.33)
  Bottom Layer w0.254: v1(45.97,39.33) 46.35,38.95 U2.1 58.8,38.95 60.45,40.6 J1.20
ST_SWCLK: length 6.4
  Top Layer w0.254: U3.37 17.31,34.76 v1(16.64,34.76)
  Bottom Layer w0.254: P1.2 17.4,38.82 16.64,38.06 v1(16.64,34.76)
ST_SWDIO: length 2.8
  Top Layer w0.254: U3.34 17.55,36.82 P1.3
USB_3.3V: length 16.6
  Top Layer w0.203: v1(92.58,27.9) 92.65,27.83 SW32.1 ; C2.2 78.65,30.64 v1(78.43,30.41)
  Bottom Layer w0.203: v1(92.58,27.9) 91.19,27.9 89.03,30.06 78.78,30.06 v1(78.43,30.41)
USB_5V: length 125.6
  Top Layer w0.203: 80.33,28.73 80.01,29.05 78.87,29.05 78.43,28.61 U1.1 78.58,27.67 C1.2 ; 80.33,28.73 80.9,29.3 80.9,34.63 81.15,34.89 82.68,34.89 83.25,34.31 C21.2 84.03,33.74 U14.4 ; 80.33,28.73 U1.3
  Top Layer w0.254: C1.2 78.45,26.63 77.69,25.87 64.26,25.87 62.1,28.03 54.86,28.03 ; 54.86,28.03 v1(25.4,28.03) ; 54.86,28.03 55.37,28.54 J2.18 ; 6.48,40.73 6.57,40.82 USB1.B9 ; R4.2 9.6,36.61 9.31,36.32 USB1.B4 7.53,36.28 6.61,36.28 6.07,36.82 6.07,40.32 6.48,40.73 2.33,40.73 0.89,39.28 0.89,28.66 1.52,28.03 11.56,28.03 v1(12.06,27.52)
  Bottom Layer w0.254: v1(25.4,28.03) 24.89,27.52 v1(12.06,27.52)
USB_D+: length 8.1
  Top Layer w0.254: v1(13.51,35.55) 13.51,37.04 13.78,37.3 ; 13.78,37.3 12.13,38.95 10.85,38.95 R5.2 ; 13.78,37.3 15.8,37.3 U3.33
USB_D-: length 6.2
  Top Layer w0.254: R3.2 11.08,39.36 12.29,39.36 13.83,37.82 U3.32
USB_RENUMN: length 12.4
  Top Layer w0.254: v1(15.88,34.25) 15.88,34.12 16.71,33.29 17.49,33.29 17.82,33.62 U3.38
  Bottom Layer w0.254: R6.2 13.51,39.26 13.72,39.46 14.61,39.46 14.86,39.2 14.86,35.39 15.88,34.38 v1(15.88,34.25)
$1N12780: length 1.4
  Bottom Layer w0.254: R12.2 12.59,35.61 11.24,35.61
$1N12782: length 5.5
  Top Layer w0.254: v1(10.41,36.16) 10.47,36.21 R4.1
  Bottom Layer w0.254: R6.1 10.6,36.98 10.41,36.79 v1(10.41,36.16) 10.41,35.78 10.25,35.61 Q1.1
$1N12786: length 2.3
  Top Layer w0.254: v1(25.53,35.01) 25.53,36.03 25.24,36.32 U3.2
$1N12787: length 5.2
  Top Layer w0.254: U3.3 25.75,36.82 v1(26.16,36.41)
  Bottom Layer w0.254: R9.1 25.91,33.74 26.16,34 v1(26.16,36.41)
$1N12790: length 7.4
  Top Layer w0.254: v1(25.91,37.55) 25.64,37.82 U3.5
  Bottom Layer w0.254: C3.1 29.01,36.58 ; 28.57,36.28 27.31,37.55 v1(25.91,37.55)
$1N12791: length 7.8
  Top Layer w0.254: U3.6 25.66,38.32 v1(25.91,38.57)
  Bottom Layer w0.254: 28.57,40.09 27.05,38.57 v1(25.91,38.57) ; C6.1 28.74,39.8
$1N12796: length 6.4
  Top Layer w0.254: v1(25.78,40.6) 25.5,40.32 U3.10
  Bottom Layer w0.254: R16.2 R15.1 25.15,39.97 v1(25.78,40.6)
$1N12798: length 8.8
  Top Layer w0.203: 24.32,38.82 25.37,38.82 25.88,39.33 v1(26.8,39.33)
  Bottom Layer w0.254: v1(26.8,39.33) 25.84,39.33 23.94,37.43 R14.1 22.61,37.35 22.61,36.45 C7.2
$1N12808: length 2.8
  Top Layer w0.254: U3.25 14.05,41.32 v1(13.97,41.24)
  Bottom Layer w0.254: R17.1 13.89,41.16 v1(13.97,41.24)
$1N12820: length 6.5
  Top Layer w0.254: U3.39 18.32,33.39 17.78,32.86 15.62,32.86 v1(14.35,34.12)
  Bottom Layer w0.254: R10.1 v1(14.35,34.12)
$1N12821: length 2.3
  Top Layer w0.254: v1(20.38,36.41) 20.82,35.98 U3.44
$1N12835: length 1.6
  Top Layer w0.127: LED2.2 5.91,31.59 R13.2
$1N33098: length 18.2
  Bottom Layer w0.254: R18.2 59.69,16.09 60.71,17.11 60.71,17.87 59.44,19.14 54.99,19.14 54.1,18.25 54.1,15.84 54.99,14.95 56.77,14.95 57.4,14.31 57.4,12.68 U5.26
$1N33099: length 3.6
  Bottom Layer w0.254: C14.2 57.42,14.95 58.09,14.29 U5.27
$1N33110: length 6.1
  Bottom Layer w0.254: C15.2 43.37,16.22 42.54,16.22 42.29,15.96 42.29,14.69 42.54,14.44 42.54,12.8 U5.5
$1N33111: length 5.4
  Bottom Layer w0.254: C15.1 42.99,16.66 42.96,16.62 42.38,16.62 41.88,16.13 41.88,14.53 41.99,14.42 U5.4
$1N33113: length 5.5
  Bottom Layer w0.254: C16.2 39.88,16.28 39.88,15.71 40.59,15 U5.2
$1N33117: length 8
  Top Layer w0.254: v1(55.48,16.05) 56.58,14.95 v1(59.82,14.95)
  Bottom Layer w0.254: U5.28 58.79,14.81 58.93,14.95 v1(59.82,14.95)
$1N33128: length 16.7
  Bottom Layer w0.254: U5.11 46.86,12.69 46.86,14.57 46.99,14.69 47.75,14.69 ; U5.14 48.99,14.28 49.02,14.31 48.64,14.69 47.75,14.69 ; 47.75,14.69 47.88,14.82 47.88,16.34 47.82,16.34 C19.1 47.94,18.12 51.56,18.12 51.56,17.11 52.71,15.96 R19.2
$1N51257: length 4.3
  Top Layer w0.203: Q3.1 67.98,31.8 68.71,31.07 68.71,29.68 69.59,28.8 R73.1
$1N53411: length 1.7
  Top Layer w0.254: R76.2 74.76,30.31 LED13.1
$1N53416: length 1.5
  Top Layer w0.203: RLED.1 87.62,30.95 U14.1
$1N53426:
  vias: v1(81.86,32.22)
$1N53430: length 1.5
  Top Layer w0.203: GLED.1 83.43,32.01 U14.5
$1N53431: length 2.1
  Bottom Layer w0.203: R1.1 90.59,30.95 v1(90.59,30.95)
$1N53442: length 1.4
  Top Layer w0.203: R77.2 84.57,30.82 U14.6
$1N53453: length 4.1
  Top Layer w0.254: Q3.2 67.6,29.9 v1(67.56,29.93)
  Bottom Layer w0.254: v1(67.56,29.93) 67.56,30.02 65.67,31.91 v1(64.52,31.91)
$1N53466:
  vias: v1(18.98,10.64)
$1N53468:
  vias: v1(20.59,17.8)
$1N53469:
  vias: v1(12.8,16.16)
$1N53470:
  vias: v1(11.11,9.18)
$1N53491:
  vias: v1(14.35,16.29)
$1N53492:
  vias: v1(14.35,10.7)
$1N53493:
  vias: v1(18.61,11.85)
$1N53494:
  vias: v1(18.67,15.02)
$1N53531: length 3.5
  Bottom Layer w0.254: C16.1 41.29,15.76 U5.3

## Copper pours and planes (outline as drawn; the poured copper is in the pictures)
GND on Top Layer: 0,50 100.08,50 100.08,-0.04 0,-0.04
GND on Bottom Layer: 0,50 100.08,50 100.08,-0.04 0,-0.04

## Text on the board
Bottom Silkscreen Layer: 3V3 | CLK | DIO | GND | BOOT0 | VBAT
Top Silkscreen Layer: LINK | Reset | BAT | USB | JLCJLCJLCJLC | GND | B12 | B13 | B14 | 3.3 | RST | B15 | B11 | A8 | B10 | A9 | A10 | B1 | A11 | B0 | A12 | A7 | A15 | A6 | A5 | B3 | A4 | B4 | B5 | A3 | A2 | B6 | A1 | B7 | A0 | B8 | B9 | 5V | C13
